# Altium schematic sheet Pump Driver.SchDoc
size A4; SheetNumber: 4; SheetTotal: 4
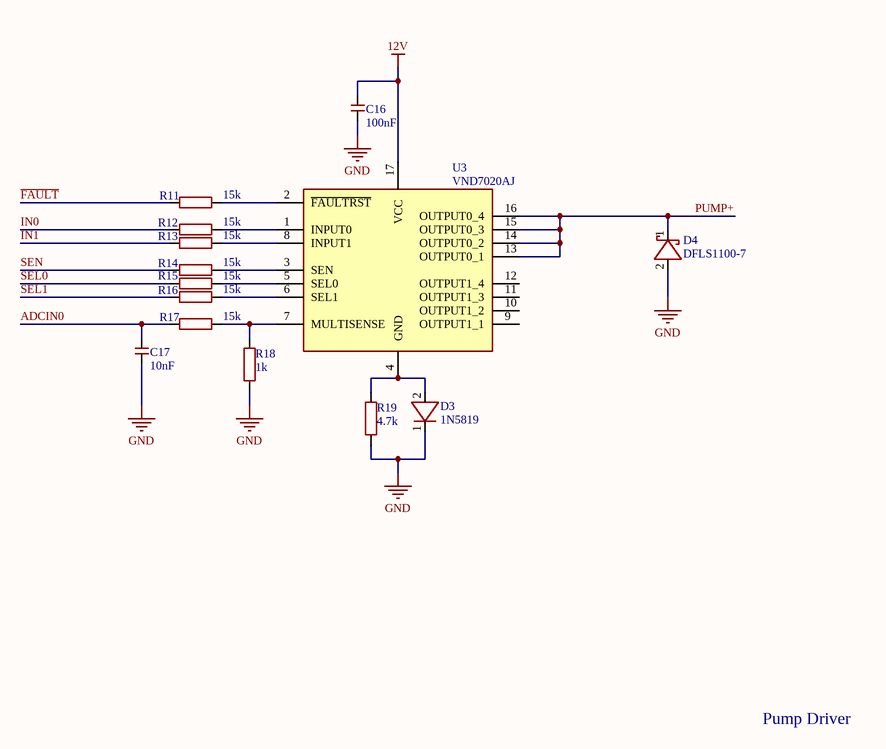
[diagram p0: Pump Driver.SchDoc]

## Parts
C16  100nF  [C0402]
C17  10nF  [C0402]
D3  1N5819  [SOD3716X125N]
D4  DFLS1100-7  [DFLS110]
R11  15k  [R0402]
R12  15k  [R0402]
R13  15k  [R0402]
R14  15k  [R0402]
R15  15k  [R0402]
R16  15k  [R0402]
R17  15k  [R0402]
R18  1k  [R0402]
R19  4.7k  [R0402]
U3  VND7020AJ  [SOP50P600X170-17N]

## Nets
12V: C16.2 U3.17(VCC)
GND: C16.1 C17.1 D3.1(K) D4.2(A) R18.1 R19.1
ADCIN0: C17.2 R17.1
~{FAULT}: R11.1
IN0: R12.1
IN1: R13.1
PUMP+: D4.1(K) U3.13(OUTPUT0_1) U3.14(OUTPUT0_2) U3.15(OUTPUT0_3) U3.16(OUTPUT0_4)
SEL0: R15.1
SEL1: R16.1
SEN: R14.1
NetD3_2: D3.2(A) R19.2 U3.4(GND)
NetR11_2: R11.2 U3.2(~{FAULTRST})
NetR12_2: R12.2 U3.1(INPUT0)
NetR13_2: R13.2 U3.8(INPUT1)
NetR14_2: R14.2 U3.3(SEN)
NetR15_2: R15.2 U3.5(SEL0)
NetR16_2: R16.2 U3.6(SEL1)
NetR17_2: R17.2 R18.2 U3.7(MULTISENSE)

Not connected (* = marked no-connect by the designer): U3 9(OUTPUT1_1) 10(OUTPUT1_2) 11(OUTPUT1_3) 12(OUTPUT1_4)

## Notes on the sheet
- Pump Driver

## Library data of the parts
C16 = C0402C104K3PACTU: Ceramic Capacitor, Multilayer, Ceramic, 25V, 10% +Tol, 10% -Tol, X5R, 15% TC, 0.1uF, Surface Mount, 0402; Manufacturer: KEMET; Multilayer: Yes; Supplier: Mouser; Supplier Part Number: 80-C0402C104K3P; Manufacturer Part Number: C0402C104K3PACTU; RoHS: Yes; Category: Ceramic Capacitors; Stock: 262570; Pricing: 1=0.12, 10=0.056, 50=0.056, 100=0.036, 1000=0.026, 10000=0.017 (USD); Mounting Technology: Surface Mount; Pins: 2; Dielectric Material: Ceramic; Package Shape: Rectangular; Case/Package: 0402; Terminal Finish: Nickel; Min Operating Temperature: -55°C; Max Operating Temperature: 85°C; JESD-609 Code: e3; Value: 100nF; Capacitor Type: Ceramic; Tolerance  (fill in as +-): 10%; Packaging: Tape and Reel; Tolerance (fill in as +-): 10%; Rated DC Voltage (URdc): 25V; Temperature Characteristics Code: X5R; Termination: Wraparound; Reach SVHC Compliant: Yes; RoHS Compliant: Yes; ComponentLink1URL: https://datasheet.ciiva.com:443/pdfs/VipMasterIC/IC/KEME/KEME-S-A0008991665/KEME-S-A0008991665-1.pdf?src-supplier=IHS+Markit; ComponentLink1Description: https://datasheet.ciiva.com:443/pdfs/VipMasterIC/IC/KEME/KEME-S-A0008991665/KEME-S-A0008991665-1.pdf?src-supplier=IHS+Markit; ComponentLink2URL: http://www.farnell.com/datasheets/2748284.pdf?src-supplier=Farnell; ComponentLink2Description: http://www.farnell.com/datasheets/2748284.pdf?src-supplier=Farnell; ComponentLink3URL: http://www.farnell.com/datasheets/2748284.pdf?src-supplier=Newark; ComponentLink3Description: http://www.farnell.com/datasheets/2748284.pdf?src-supplier=Newark; ComponentLink4URL: https://datasheet.octopart.com/C0402C104K3PACTU-KEMET-datasheet-181956028.pdf?src-supplier=Element14; ComponentLink4Description: https://datasheet.octopart.com/C0402C104K3PACTU-KEMET-datasheet-181956028.pdf?src-supplier=Element14
C17 = C0402T103K4RALTU: Ceramic Capacitor, Multilayer, Ceramic, 16V, 10% +Tol, 10% -Tol, X7R, 15% TC, 0.01uF, Surface Mount, 0402; Manufacturer: KEMET; Multilayer: Yes; Supplier: Mouser; Supplier Part Number: 80-C0402T103K4RALTU; Manufacturer Part Number: C0402T103K4RALTU; RoHS: No; Category: Ceramic Capacitors; Stock: 17779; Pricing: 1=0.58, 10=0.42, 50=0.42, 100=0.337, 1000=0.294, 10000=0.246 (USD); Mounting Technology: Surface Mount; Pins: 2; Dielectric Material: Ceramic; Package Shape: Rectangular; Case/Package: 0402; Terminal Finish: Nickel; Min Operating Temperature: -55°C; Max Operating Temperature: 125°C; JESD-609 Code: e0; Value: 10nF; Capacitor Type: Ceramic; Tolerance  (fill in as +-): 10%; Package Style: SMTMeter; Packaging: Tape and Reel; Tolerance (fill in as +-): 10%; Rated DC Voltage (URdc): 16V; Temperature Characteristics Code: X7R; Termination: Wraparound; Length: 1mm; Width: 0.5mm; Height: 0.5mm; RoHS Compliant: No; Reach SVHC Compliant: No; ComponentLink1URL: https://datasheet.ciiva.com:443/pdfs/VipMasterIC/IC/KEME/KEME-S-A0008487487/KEME-S-A0008487487-1.pdf?src-supplier=IHS+Markit; ComponentLink1Description: https://datasheet.ciiva.com:443/pdfs/VipMasterIC/IC/KEME/KEME-S-A0008487487/KEME-S-A0008487487-1.pdf?src-supplier=IHS+Markit; ComponentLink2URL: https://datasheet.ciiva.com/15379/kem-c1027-x7r-cots-smd-15379193.pdf?src-supplier=Mouser; ComponentLink2Description: https://datasheet.ciiva.com/15379/kem-c1027-x7r-cots-smd-15379193.pdf?src-supplier=Mouser; ComponentLink3URL: https://datasheet.ciiva.com/148/kem-c1027-x7r-cots-smd-148853.pdf?src-supplier=Digikey; ComponentLink3Description: https://datasheet.ciiva.com/148/kem-c1027-x7r-cots-smd-148853.pdf?src-supplier=Digikey; ComponentLink4URL: https://datasheet.ciiva.com/148/kem-c1027-x7r-cots-smd-148851.pdf?src-supplier=Digikey; ComponentLink4Description: https://datasheet.ciiva.com/148/kem-c1027-x7r-cots-smd-148851.pdf?src-supplier=Digikey; ComponentLink5URL: https://datasheet.ciiva.com/148/kem-c1027-x7r-cots-smd-148852.pdf?src-supplier=Digikey; ComponentLink5Description: https://datasheet.ciiva.com/148/kem-c1027-x7r-cots-smd-148852.pdf?src-supplier=Digikey
D3 = 1N5819HW-7-F: Rectifier Diode, Schottky, 1 Phase, 1 Element, 1A, 40V V(RRM), Silicon; Manufacturer: Diodes; Package Body Material: Plastic; Number of Elements: 1; Max Power Dissipation: 450mW; Forward Voltage: 320mV; Non-rep Pk Forward Current-Max: 25A; Time @ Peak Reflow Temperature-Max (s): 40s; Qualification Status: Not Qualified; Supplier: Mouser; Supplier Part Number: 621-1N5819HW-F; Manufacturer Part Number: 1N5819HW-7-F; RoHS: Yes; Category: Schottky Diodes; Stock: 170615; Pricing: 1=0.25, 10=0.168, 50=0.168, 100=0.121, 1000=0.091, 10000=0.05 (USD); Pins: 2; Diode Element Material: SILICON; Package Shape: Rectangular; Terminal Finish: Tin; Min Operating Temperature: -65°C; Max Operating Temperature: 125°C; Diode Type: RECTIFIER; JESD-30 Code: R-PDSO-G2; Max Output current: 1A; Package Style: SMALL OUTLINEMeter; Rep Pk Reverse Voltage-Max: 40V; Surface Mount: Yes; Technology: SCHOTTKY; Terminal Form: Gull Wing; Terminal Position: DUAL; JESD-609 Code: e3; Moisture Sensitivity Level: 1; Peak Reflow Temperature (Cel): 260°C; Reach SVHC Compliant: Yes; RoHS Compliant: Yes; ComponentLink1URL: https://datasheet.ciiva.com:443/pdfs/VipMasterIC/IC/DIOD/DIOD-S-A0009689747/DIOD-S-A0009691035-1.pdf?src-supplier=IHS+Markit; ComponentLink1Description: https://datasheet.ciiva.com:443/pdfs/VipMasterIC/IC/DIOD/DIOD-S-A0009689747/DIOD-S-A0009691035-1.pdf?src-supplier=IHS+Markit; ComponentLink2URL: https://datasheet.ciiva.com/27092/1538419-27092484.pdf?src-supplier=Jameco; ComponentLink2Description: https://datasheet.ciiva.com/27092/1538419-27092484.pdf?src-supplier=Jameco; ComponentLink3URL: https://datasheet.ciiva.com/16303/ds30217-16303296.pdf?src-supplier=Future+Electronics; ComponentLink3Description: https://datasheet.ciiva.com/16303/ds30217-16303296.pdf?src-supplier=Future+Electronics; ComponentLink4URL: https://datasheet.ciiva.com/1177/ds30217-1177089.pdf?src-supplier=Element14; ComponentLink4Description: https://datasheet.ciiva.com/1177/ds30217-1177089.pdf?src-supplier=Element14; ComponentLink5URL: https://datasheet.ciiva.com/8303/ds30217-8303132.pdf?src-supplier=Avnet; ComponentLink5Description: https://datasheet.ciiva.com/8303/ds30217-8303132.pdf?src-supplier=Avnet; ComponentLink6URL: https://datasheet.ciiva.com/912/ds30217-912802.pdf?src-supplier=Digikey; ComponentLink6Description: https://datasheet.ciiva.com/912/ds30217-912802.pdf?src-supplier=Digikey; ComponentLink7URL: https://datasheet.ciiva.com/912/ds30217-912803.pdf?src-supplier=Digikey; ComponentLink7Description: https://datasheet.ciiva.com/912/ds30217-912803.pdf?src-supplier=Digikey; ComponentLink8URL: https://datasheet.ciiva.com/912/ds30217-912801.pdf?src-supplier=Digikey; ComponentLink8Description: https://datasheet.ciiva.com/912/ds30217-912801.pdf?src-supplier=Digikey
D4 = DFLS1100-7: Rectifier Diode, Schottky, 1 Phase, 1 Element, 1A, 100V V(RRM), Silicon; Manufacturer: Diodes; Package Body Material: Plastic; Case Connection: CATHODE; Forward Voltage: 770mV; Non-rep Pk Forward Current-Max: 40A; Number of Elements: 1; Time @ Peak Reflow Temperature-Max (s): 40s; Qualification Status: Not Qualified; Supplier: Digikey; Supplier Part Number: DFLS1100DICT-ND; Manufacturer Part Number: DFLS1100-7; RoHS: Yes; Category: Rectifier Diodes; Stock: 32532; Pricing: 1=0.4, 10=0.34, 100=0.2363, 500=0.18452, 1000=0.14998 (USD); Pins: 2; Diode Element Material: SILICON; Package Shape: Rectangular; Terminal Finish: Tin; Min Operating Temperature: -55°C; Max Operating Temperature: 175°C; JESD-609 Code: e3; Diode Type: RECTIFIER; JESD-30 Code: R-PDSO-F2; Moisture Sensitivity Level: 1; Max Output current: 1A; Package Style: SMALL OUTLINEMeter; Peak Reflow Temperature (Cel): 260°C; Rep Pk Reverse Voltage-Max: 100V; Surface Mount: Yes; Technology: SCHOTTKY; Terminal Form: Flat; Terminal Position: DUAL; RoHS Compliant: Yes; Reach SVHC Compliant: No; ComponentLink1URL: https://datasheet.ciiva.com:443/pdfs/VipMasterIC/IC/DIOD/DIOD-S-A0001756819/DIOD-S-A0001756819-1.pdf?src-supplier=IHS+Markit; ComponentLink1Description: https://datasheet.ciiva.com:443/pdfs/VipMasterIC/IC/DIOD/DIOD-S-A0001756819/DIOD-S-A0001756819-1.pdf?src-supplier=IHS+Markit; ComponentLink2URL: https://datasheet.ciiva.com/4715/ds30497-81105-4715653.pdf?src-supplier=Mouser; ComponentLink2Description: https://datasheet.ciiva.com/4715/ds30497-81105-4715653.pdf?src-supplier=Mouser; ComponentLink3URL: https://datasheet.ciiva.com/6932/ds30497-6932064.pdf?src-supplier=Newark; ComponentLink3Description: https://datasheet.ciiva.com/6932/ds30497-6932064.pdf?src-supplier=Newark; ComponentLink4URL: https://datasheet.ciiva.com/4245/2460ds30497-4245287.pdf?src-supplier=Arrow+Electronics; ComponentLink4Description: https://datasheet.ciiva.com/4245/2460ds30497-4245287.pdf?src-supplier=Arrow+Electronics; ComponentLink5URL: https://datasheet.ciiva.com/22695/1915475-22695803.pdf?src-supplier=Element14; ComponentLink5Description: https://datasheet.ciiva.com/22695/1915475-22695803.pdf?src-supplier=Element14; ComponentLink6URL: https://datasheet.ciiva.com/7964/ds30497-7964246.pdf?src-supplier=Element14; ComponentLink6Description: https://datasheet.ciiva.com/7964/ds30497-7964246.pdf?src-supplier=Element14; ComponentLink7URL: https://datasheet.ciiva.com/914/ds30497-914548.pdf?src-supplier=Digikey; ComponentLink7Description: https://datasheet.ciiva.com/914/ds30497-914548.pdf?src-supplier=Digikey; ComponentLink8URL: https://datasheet.ciiva.com/914/ds30497-914549.pdf?src-supplier=Digikey; ComponentLink8Description: https://datasheet.ciiva.com/914/ds30497-914549.pdf?src-supplier=Digikey; ComponentLink9URL: https://datasheet.ciiva.com/914/ds30497-914550.pdf?src-supplier=Digikey; ComponentLink9Description: https://datasheet.ciiva.com/914/ds30497-914550.pdf?src-supplier=Digikey
R11-R17 = AC0402JR-7W15KL: Chip Resistor Automotive Grade Thick Film 0402 15kOhm 5% Paper T/R; Manufacturer: Yageo; Supplier: Mouser; Supplier Part Number: 603-AC0402JR-7W15KL; Manufacturer Part Number: AC0402JR-7W15KL; RoHS: No; Category: Chip SMD Resistors; Stock: 9990; Pricing: 1=0.15, 10=0.015, 50=0.015, 100=0.01, 1000=0.008, 10000=0.003 (USD)
R18 = RT0402FRE101KL: Fixed Resistor, Thin Film, 0.0625W, 1000ohm, 50V, 1% +/-Tol, 50ppm/Cel, Surface Mount, 0402; Manufacturer: Yageo; Supplier: Mouser; Supplier Part Number: 603-RT0402FRE101KL; Manufacturer Part Number: RT0402FRE101KL; RoHS: Yes; Category: Chip SMD Resistors; Stock: 2470; Pricing: 1=0.1, 10=0.026, 50=0.026, 100=0.02, 1000=0.015, 10000=0.01 (USD); Reach SVHC Compliant: Yes; RoHS Compliant: Yes
R19 = RC0402FR-7W4K7L: Fixed Resistor, Metal Glaze/thick Film, 0.125W, 4700ohm, 50V, 1% +/-Tol, 200ppm/Cel, Surface Mount, 0402; Manufacturer: Yageo; Additional Feature: LASER TRIMMABLE; Power: 125mW; Rated Temperature: 70°C; Value: 4.7kR; Temperature Coefficient (ppm/Cel): 200; Package Height: 0.35mm; Package Length: 1mm; Package Width: 0.5mm; Supplier: Mouser; Supplier Part Number: 603-RC0402FR-7W4K7L; Manufacturer Part Number: RC0402FR-7W4K7L; RoHS: Yes; Category: Chip SMD Resistors; Stock: 9262; Pricing: 1=0.15, 10=0.015, 50=0.015, 100=0.01, 1000=0.008, 10000=0.003 (USD); Mounting Technology: Surface Mount; Pins: 2; Package Shape: Rectangular; Case/Package: 0402; Terminal Finish: Nickel; Min Operating Temperature: -55°C; Max Operating Temperature: 155°C; Tolerance: 1%; JESD-609 Code: e3; Resistor Type: FIXED RESISTOR; Construction: Chip; Packaging: Tape and Reel; Technology: METAL GLAZE/THICK FILM; Termination: Wraparound; Working Voltage: 50V; Reach SVHC Compliant: Yes; RoHS Compliant: Yes; ComponentLink1URL: https://datasheet.ciiva.com:443/pdfs/VipMasterIC/IC/YAGO/YAGO-S-A0008145938/YAGO-S-A0008145938-1.pdf?src-supplier=IHS+Markit; ComponentLink1Description: https://datasheet.ciiva.com:443/pdfs/VipMasterIC/IC/YAGO/YAGO-S-A0008145938/YAGO-S-A0008145938-1.pdf?src-supplier=IHS+Markit
U3 = VND7020AJTR: Buffer/Inverter Based Peripheral Driver, PDSO16; Manufacturer: STMicroelectronics; Package Body Material: Plastic; Built-in Protections: Over Current,Over Voltage,Under Voltage,TRANSIENT,THERMAL; Interface IC Type: BUFFER OR INVERTER BASED PERIPHERAL DRIVER; Channels: 1; Output Current Flow Direction: SINK; Max Supply Voltage: 28V; Min Supply Voltage: 4V; Nominal Supply Voltage: 13V; Turn-Off Delay Time: 100us; Turn-On Delay Time: 120us; Supplier: Mouser; Supplier Part Number: 511-VND7020AJTR; Manufacturer Part Number: VND7020AJTR; RoHS: Yes; Category: Power Management ICs; Stock: 132353; Pricing: 1=2.79, 10=2.05, 50=1.93, 100=1.77, 1000=1.53, 10000=1.41 (USD); Case/Package: HLSSOP; Pins: 16; Package Shape: Rectangular; Min Operating Temperature: -40°C; Max Operating Temperature: 125°C; JESD-30 Code: R-PDSO-G16; Package Style: SMALL OUTLINE, HEAT SINK/SLUG, LOW PROFILE, SHRINK PITCHMeter; Surface Mount: Yes; Terminal Form: Gull Wing; Terminal Position: DUAL; Length: 4.9mm; Width: 3.9mm; Height - Seated (Max): 1.7mm; Terminal Pitch: 0.5mm; Reach SVHC Compliant: Yes; RoHS Compliant: Yes; Temperature Grade: AUTOMOTIVE; ComponentLink1URL: https://datasheet.ciiva.com:443/pdfs/VipMasterIC/IC/SGST/SGST-S-A0003587758/SGST-S-A0003587758-1.pdf?src-supplier=IHS+Markit; ComponentLink1Description: https://datasheet.ciiva.com:443/pdfs/VipMasterIC/IC/SGST/SGST-S-A0003587758/SGST-S-A0003587758-1.pdf?src-supplier=IHS+Markit; ComponentLink2URL: http://www.st.com/content/ccc/resource/technical/document/datasheet/53/f9/e8/69/7d/b8/4a/10/DM00157075.pdf/files/DM00157075.pdf/jcr:content/translations/en.DM00157075.pdf?src-supplier=Digikey; ComponentLink2Description: http://www.st.com/content/ccc/resource/technical/document/datasheet/53/f9/e8/69/7d/b8/4a/10/DM00157075.pdf/files/DM00157075.pdf/jcr:content/translations/en.DM00157075.pdf?src-supplier=Digikey; ComponentLink3URL: http://www.st.com/st-web-ui/static/active/en/resource/technical/document/datasheet/DM00157075.pdf?src-supplier=Avnet; ComponentLink3Description: http://www.st.com/st-web-ui/static/active/en/resource/technical/document/datasheet/DM00157075.pdf?src-supplier=Avnet; ComponentLink4URL: https://datasheet.octopart.com/VND7020AJTR-STMicroelectronics-datasheet-42731139.pdf?src-supplier=Future+Electronics; ComponentLink4Description: https://datasheet.octopart.com/VND7020AJTR-STMicroelectronics-datasheet-42731139.pdf?src-supplier=Future+Electronics; ComponentLink5URL: https://datasheet.octopart.com/VND7020AJTR-STMicroelectronics-datasheet-158447462.pdf?src-supplier=SHENGYU+ELECTRONICS; ComponentLink5Description: https://datasheet.octopart.com/VND7020AJTR-STMicroelectronics-datasheet-158447462.pdf?src-supplier=SHENGYU+ELECTRONICS; ComponentLink6URL: https://datasheet.octopart.com/VND7020AJTR-STMicroelectronics-datasheet-140368810.pdf?src-supplier=TME; ComponentLink6Description: https://datasheet.octopart.com/VND7020AJTR-STMicroelectronics-datasheet-140368810.pdf?src-supplier=TME